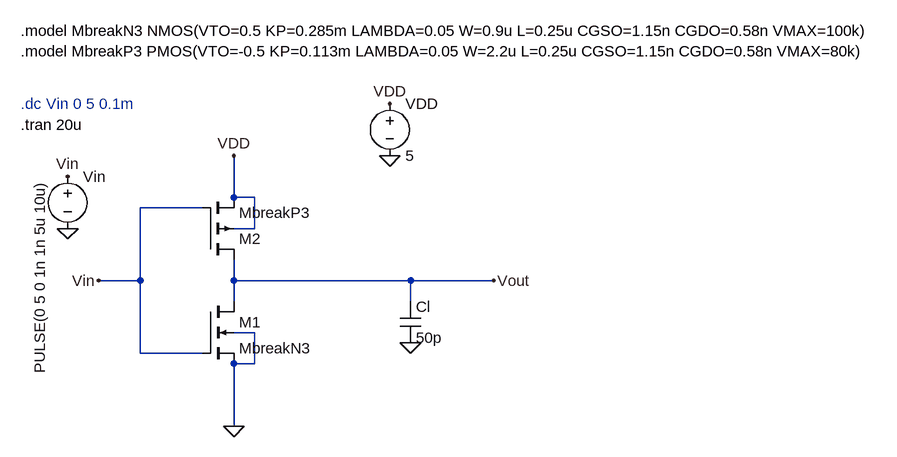
[diagram p0: schematic 4.asc]
4.asc, the LTspice schematic file:
Version 4.1
SHEET 1 1392 680
WIRE 320 208 320 144
WIRE 352 208 320 208
WIRE 272 224 176 224
WIRE 352 256 352 208
WIRE 352 256 320 256
WIRE 176 336 176 224
WIRE 176 336 112 336
WIRE 320 336 320 304
WIRE 592 336 320 336
WIRE 720 336 592 336
WIRE 320 368 320 336
WIRE 592 368 592 336
WIRE 352 416 320 416
WIRE 176 448 176 336
WIRE 272 448 176 448
WIRE 352 464 352 416
WIRE 352 464 320 464
WIRE 320 560 320 464
FLAG 320 560 0
FLAG 560 144 0
FLAG 560 64 VDD
FLAG 320 144 VDD
FLAG 64 256 0
FLAG 64 176 Vin
FLAG 112 336 Vin
FLAG 720 336 Vout
FLAG 592 432 0
SYMBOL nmos4 272 368 R0
SYMATTR InstName M1
SYMATTR Value MbreakN3
SYMATTR Value2 l=0.5u w=2u
SYMBOL pmos4 272 304 M180
SYMATTR InstName M2
SYMATTR Value MbreakP3
SYMATTR Value2 l=0.5u w=5u
SYMBOL voltage 560 48 R0
WINDOW 123 0 0 Left 0
WINDOW 39 0 0 Left 0
SYMATTR InstName VDD
SYMATTR Value 5
SYMBOL voltage 64 160 R0
WINDOW 123 0 0 Left 0
WINDOW 39 0 0 Left 0
WINDOW 3 -43 319 VLeft 2
SYMATTR InstName Vin
SYMATTR Value PULSE(0 5 0 1n 1n 5u 10u)
SYMBOL cap 576 368 R0
SYMATTR InstName Cl
SYMATTR Value 50p
TEXT -8 -48 Left 2 !.model MbreakN3 NMOS(VTO=0.5 KP=0.285m LAMBDA=0.05 W=0.9u L=0.25u CGSO=1.15n CGDO=0.58n VMAX=100k)\n.model MbreakP3 PMOS(VTO=-0.5 KP=0.113m LAMBDA=0.05 W=2.2u L=0.25u CGSO=1.15n CGDO=0.58n VMAX=80k)
TEXT -8 64 Left 2 ;.dc Vin 0 5 0.1m
TEXT -8 96 Left 2 !.tran 20u

The netlist it stands for:
* 4.asc
M1 Vout Vin 0 0 MbreakN3 l=0.5u w=2u
M2 Vout Vin VDD VDD MbreakP3 l=0.5u w=5u
VDD VDD 0 5
Vin Vin 0 PULSE(0 5 0 1n 1n 5u 10u)
Cl Vout 0 50p
.model NMOS NMOS
.model PMOS PMOS
.lib standard.mos
.model MbreakN3 NMOS(VTO=0.5 KP=0.285m LAMBDA=0.05 W=0.9u L=0.25u CGSO=1.15n CGDO=0.58n VMAX=100k)
.model MbreakP3 PMOS(VTO=-0.5 KP=0.113m LAMBDA=0.05 W=2.2u L=0.25u CGSO=1.15n CGDO=0.58n VMAX=80k)
* .dc Vin 0 5 0.1m
.tran 20u
.backanno
.end